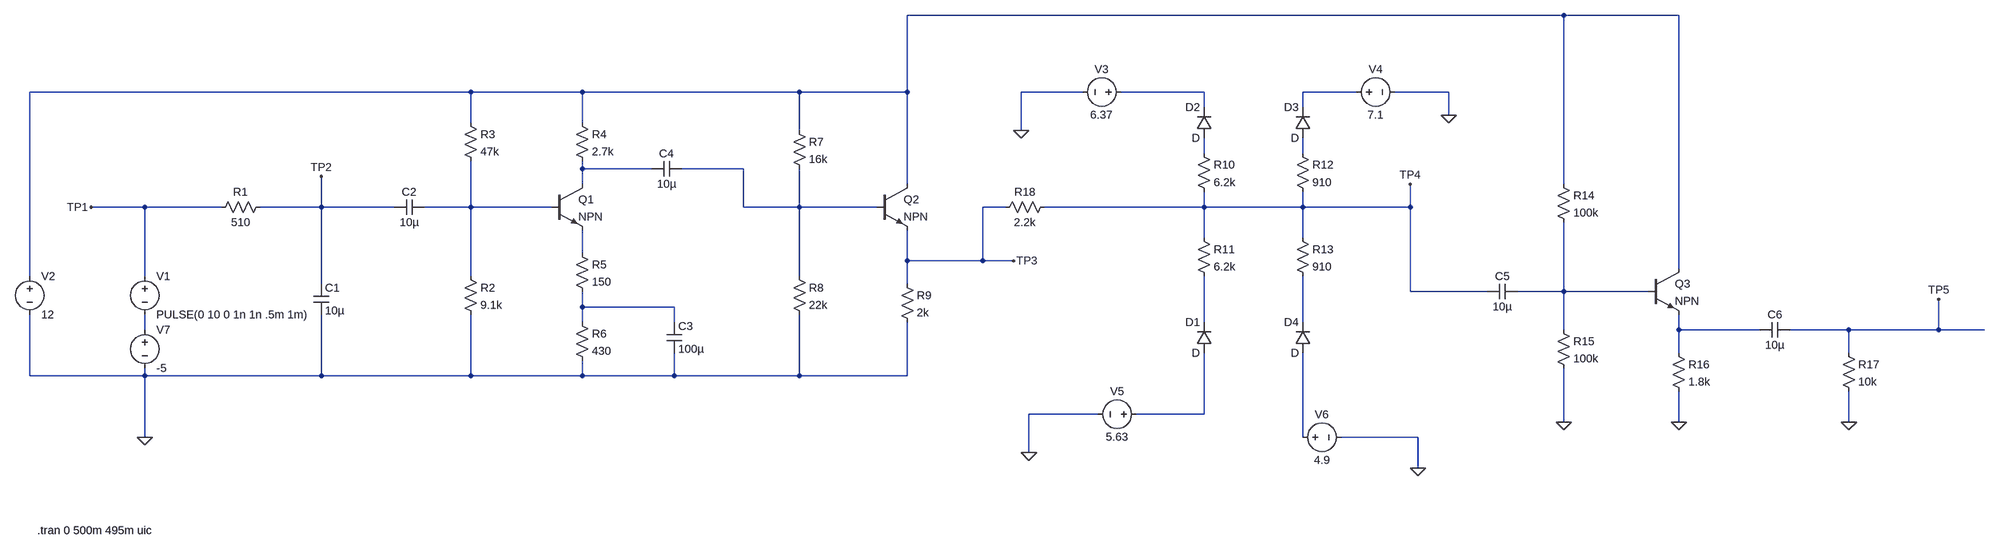
[diagram p0: schematic 4.asc]
4.asc, the LTspice schematic file:
Version 4.1
SHEET 1 4596 744
WIRE 3424 -368 1872 -368
WIRE 3824 -368 3424 -368
WIRE 768 -208 -240 -208
WIRE 1024 -208 768 -208
WIRE 1632 -208 1024 -208
WIRE 1872 -208 1872 -368
WIRE 1872 -208 1632 -208
WIRE 2304 -208 2176 -208
WIRE 2624 -208 2384 -208
WIRE 2992 -208 2880 -208
WIRE 3184 -208 3072 -208
WIRE 2624 -176 2624 -208
WIRE 2880 -176 2880 -208
WIRE 3184 -160 3184 -208
WIRE 768 -144 768 -208
WIRE 1024 -144 1024 -208
WIRE 1632 -128 1632 -208
WIRE 2176 -128 2176 -208
WIRE 2624 -80 2624 -112
WIRE 2880 -80 2880 -112
WIRE 1024 -48 1024 -64
WIRE 1168 -48 1024 -48
WIRE 1360 -48 1232 -48
WIRE 1024 -16 1024 -48
WIRE 1872 -16 1872 -208
WIRE 3424 -16 3424 -368
WIRE 0 32 -112 32
WIRE 160 32 0 32
WIRE 368 32 368 -32
WIRE 368 32 240 32
WIRE 608 32 368 32
WIRE 768 32 768 -64
WIRE 768 32 672 32
WIRE 960 32 768 32
WIRE 1360 32 1360 -48
WIRE 1632 32 1632 -48
WIRE 1632 32 1360 32
WIRE 1808 32 1632 32
WIRE 2144 32 2096 32
WIRE 2624 32 2624 0
WIRE 2624 32 2224 32
WIRE 2880 32 2880 0
WIRE 2880 32 2624 32
WIRE 3104 32 3104 -16
WIRE 3104 32 2880 32
WIRE 2624 96 2624 32
WIRE 2880 96 2880 32
WIRE 1024 128 1024 80
WIRE 1872 144 1872 80
WIRE 2096 144 2096 32
WIRE 2096 144 1872 144
WIRE 2160 144 2096 144
WIRE 3824 160 3824 -368
WIRE -240 176 -240 -208
WIRE 0 176 0 32
WIRE 768 176 768 32
WIRE 1632 176 1632 32
WIRE 368 192 368 32
WIRE 1872 192 1872 144
WIRE 3104 208 3104 32
WIRE 3264 208 3104 208
WIRE 3424 208 3424 64
WIRE 3424 208 3328 208
WIRE 3760 208 3424 208
WIRE 1024 240 1024 208
WIRE 1216 240 1024 240
WIRE 1024 272 1024 240
WIRE 1216 272 1216 240
WIRE 2624 272 2624 176
WIRE 2880 272 2880 176
WIRE 0 288 0 256
WIRE 3424 288 3424 208
WIRE 3824 288 3824 256
WIRE 4064 288 3824 288
WIRE 4272 288 4128 288
WIRE 4496 288 4496 224
WIRE 4496 288 4272 288
WIRE 4592 288 4496 288
WIRE 3824 336 3824 288
WIRE 4272 336 4272 288
WIRE -240 384 -240 256
WIRE 0 384 0 368
WIRE 0 384 -240 384
WIRE 368 384 368 256
WIRE 368 384 0 384
WIRE 768 384 768 256
WIRE 768 384 368 384
WIRE 1024 384 1024 352
WIRE 1024 384 768 384
WIRE 1216 384 1216 336
WIRE 1216 384 1024 384
WIRE 1632 384 1632 256
WIRE 1632 384 1216 384
WIRE 1872 384 1872 272
WIRE 1872 384 1632 384
WIRE 2336 464 2192 464
WIRE 2624 464 2624 336
WIRE 2624 464 2416 464
WIRE 3424 480 3424 368
WIRE 3824 480 3824 416
WIRE 4272 480 4272 416
WIRE 0 512 0 384
WIRE 2880 512 2880 336
WIRE 3120 512 2960 512
WIRE 2192 544 2192 464
WIRE 3120 576 3120 512
FLAG 0 512 0
FLAG 3424 480 0
FLAG 3824 480 0
FLAG 4272 480 0
FLAG 2176 -128 0
FLAG 3184 -160 0
FLAG 2192 544 0
FLAG 3120 576 0
FLAG -112 32 TP1
FLAG 368 -32 TP2
FLAG 2160 144 TP3
FLAG 3104 -16 TP4
FLAG 4496 224 TP5
SYMBOL voltage 0 160 R0
WINDOW 123 0 0 Left 0
WINDOW 39 0 0 Left 0
SYMATTR InstName V1
SYMATTR Value PULSE(0 10 0 1n 1n .5m 1m)
SYMBOL res 256 16 R90
WINDOW 0 0 56 VBottom 2
WINDOW 3 32 56 VTop 2
SYMATTR InstName R1
SYMATTR Value 510
SYMBOL cap 352 192 R0
SYMATTR InstName C1
SYMATTR Value 10µ
SYMBOL cap 672 16 R90
WINDOW 0 0 32 VBottom 2
WINDOW 3 32 32 VTop 2
SYMATTR InstName C2
SYMATTR Value 10µ
SYMBOL res 752 160 R0
SYMATTR InstName R2
SYMATTR Value 9.1k
SYMBOL res 752 -160 R0
SYMATTR InstName R3
SYMATTR Value 47k
SYMBOL voltage -240 160 R0
WINDOW 123 0 0 Left 0
WINDOW 39 0 0 Left 0
SYMATTR InstName V2
SYMATTR Value 12
SYMBOL npn 960 -16 R0
SYMATTR InstName Q1
SYMBOL res 1008 -160 R0
SYMATTR InstName R4
SYMATTR Value 2.7k
SYMBOL res 1008 112 R0
SYMATTR InstName R5
SYMATTR Value 150
SYMBOL res 1008 256 R0
SYMATTR InstName R6
SYMATTR Value 430
SYMBOL cap 1200 272 R0
SYMATTR InstName C3
SYMATTR Value 100µ
SYMBOL res 1616 -144 R0
SYMATTR InstName R7
SYMATTR Value 16k
SYMBOL res 1616 160 R0
SYMATTR InstName R8
SYMATTR Value 22k
SYMBOL cap 1232 -64 R90
WINDOW 0 0 32 VBottom 2
WINDOW 3 32 32 VTop 2
SYMATTR InstName C4
SYMATTR Value 10µ
SYMBOL npn 1808 -16 R0
SYMATTR InstName Q2
SYMBOL res 1856 176 R0
SYMATTR InstName R9
SYMATTR Value 2k
SYMBOL res 2608 -96 R0
SYMATTR InstName R10
SYMATTR Value 6.2k
SYMBOL res 2608 80 R0
SYMATTR InstName R11
SYMATTR Value 6.2k
SYMBOL diode 2640 336 R180
WINDOW 0 24 64 Left 2
WINDOW 3 24 0 Left 2
SYMATTR InstName D1
SYMBOL diode 2640 -112 R180
WINDOW 0 24 64 Left 2
WINDOW 3 24 0 Left 2
SYMATTR InstName D2
SYMBOL res 2864 -96 R0
SYMATTR InstName R12
SYMATTR Value 910
SYMBOL diode 2896 -112 R180
WINDOW 0 24 64 Left 2
WINDOW 3 24 0 Left 2
SYMATTR InstName D3
SYMBOL diode 2896 336 R180
WINDOW 0 24 64 Left 2
WINDOW 3 24 0 Left 2
SYMATTR InstName D4
SYMBOL res 2864 80 R0
SYMATTR InstName R13
SYMATTR Value 910
SYMBOL res 3408 -32 R0
SYMATTR InstName R14
SYMATTR Value 100k
SYMBOL res 3408 272 R0
SYMATTR InstName R15
SYMATTR Value 100k
SYMBOL cap 3328 192 R90
WINDOW 0 0 32 VBottom 2
WINDOW 3 32 32 VTop 2
SYMATTR InstName C5
SYMATTR Value 10µ
SYMBOL npn 3760 160 R0
SYMATTR InstName Q3
SYMBOL res 3808 320 R0
SYMATTR InstName R16
SYMATTR Value 1.8k
SYMBOL cap 4128 272 R90
WINDOW 0 0 32 VBottom 2
WINDOW 3 32 32 VTop 2
SYMATTR InstName C6
SYMATTR Value 10µ
SYMBOL res 4256 320 R0
SYMATTR InstName R17
SYMATTR Value 10k
SYMBOL voltage 2400 -208 R90
WINDOW 0 -32 56 VBottom 2
WINDOW 3 32 56 VTop 2
WINDOW 123 0 0 Left 0
WINDOW 39 0 0 Left 0
SYMATTR InstName V3
SYMATTR Value 6.37
SYMBOL voltage 2976 -208 R270
WINDOW 0 32 56 VTop 2
WINDOW 3 -32 56 VBottom 2
WINDOW 123 0 0 Left 0
WINDOW 39 0 0 Left 0
SYMATTR InstName V4
SYMATTR Value 7.1
SYMBOL voltage 2432 464 R90
WINDOW 0 -32 56 VBottom 2
WINDOW 3 32 56 VTop 2
WINDOW 123 0 0 Left 0
WINDOW 39 0 0 Left 0
SYMATTR InstName V5
SYMATTR Value 5.63
SYMBOL voltage 2864 512 R270
WINDOW 0 32 56 VTop 2
WINDOW 3 -32 56 VBottom 2
WINDOW 123 0 0 Left 0
WINDOW 39 0 0 Left 0
SYMATTR InstName V6
SYMATTR Value 4.9
SYMBOL voltage 0 272 R0
WINDOW 123 0 0 Left 0
WINDOW 39 0 0 Left 0
SYMATTR InstName V7
SYMATTR Value -5
SYMBOL res 2240 16 R90
WINDOW 0 0 56 VBottom 2
WINDOW 3 32 56 VTop 2
SYMATTR InstName R18
SYMATTR Value 2.2k
TEXT -224 728 Left 2 !.tran 0 500m 495m uic

The netlist it stands for:
* 4.asc
V1 TP1 N014 PULSE(0 10 0 1n 1n .5m 1m)
R1 TP2 TP1 510
C1 TP2 0 10µ
C2 N008 TP2 10µ
R2 N008 0 9.1k
R3 N001 N008 47k
V2 N001 0 12
Q1 N006 N008 N009 0 NPN
R4 N001 N006 2.7k
R5 N009 N011 150
R6 N011 0 430
C3 N011 0 100µ
R7 N001 N007 16k
R8 N007 0 22k
C4 N007 N006 10µ
Q2 N001 N007 TP3 0 NPN
R9 TP3 0 2k
R10 N004 TP4 6.2k
R11 TP4 N012 6.2k
D1 N016 N012 D
D2 N004 N002 D
R12 N005 TP4 910
D3 N005 N003 D
D4 N017 N013 D
R13 TP4 N013 910
R14 N001 N010 100k
R15 N010 0 100k
C5 N010 TP4 10µ
Q3 N001 N010 N015 0 NPN
R16 N015 0 1.8k
C6 TP5 N015 10µ
R17 TP5 0 10k
V3 N002 0 6.37
V4 N003 0 7.1
V5 N016 0 5.63
V6 N017 0 4.9
V7 N014 0 -5
R18 TP4 TP3 2.2k
.model D D
.lib standard.dio
.model NPN NPN
.model PNP PNP
.lib standard.bjt
.tran 0 500m 495m uic
.backanno
.end

* Results of the author's LTspice run, read from the files saved beside the schematic
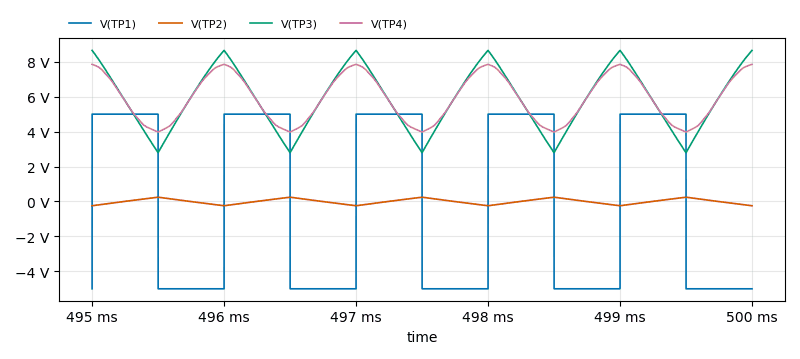
[diagram p1: Transient Analysis of 4.asc, plotted from the saved traces]
* Transient Analysis, 1 run:
*   V(TP1): min -5 V, max 5 V, average 9.998 µV, rms 5 V, last -5 V
*   V(TP2): min -244.7 mV, max 245.1 mV, average 200.8 µV, rms 141.6 mV, last -244.6 mV
*   V(TP3): min 2.791 V, max 8.652 V, average 5.826 V, rms 6.075 V, last 8.651 V
*   V(TP4): min 3.977 V, max 7.855 V, average 5.883 V, rms 6.03 V, last 7.855 V